# EasyEDA Pro project P3+KG.epro, board PCB5
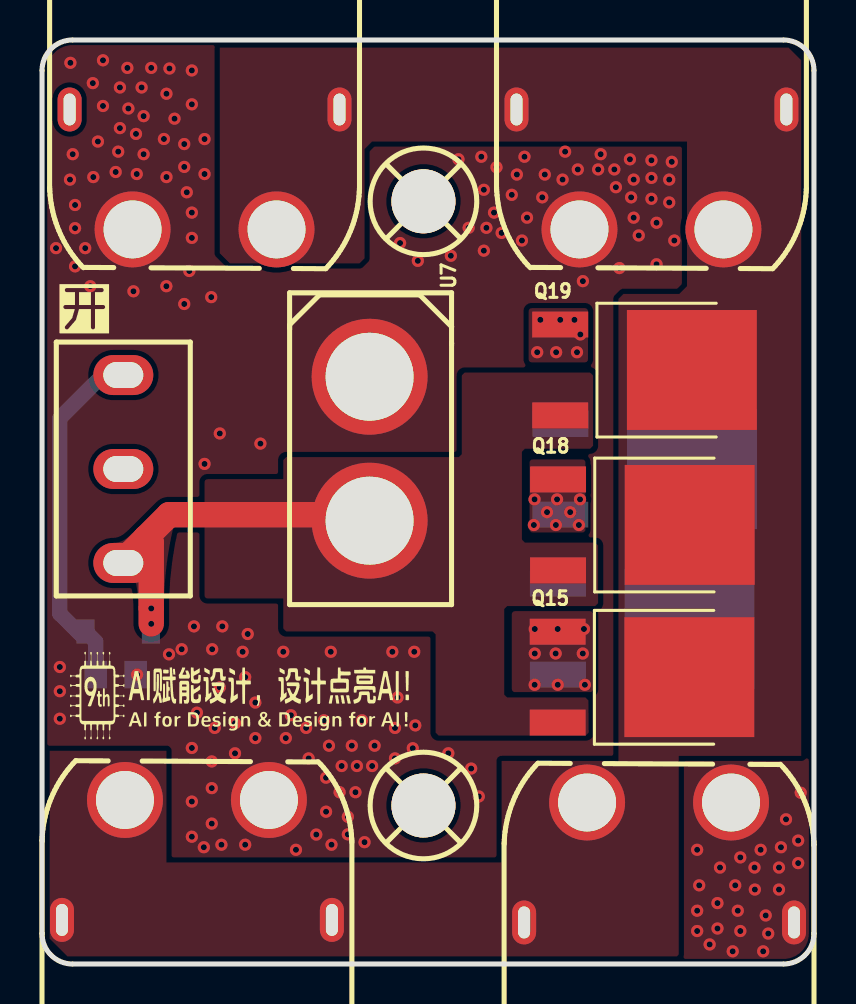
[diagram p7: board, top side]
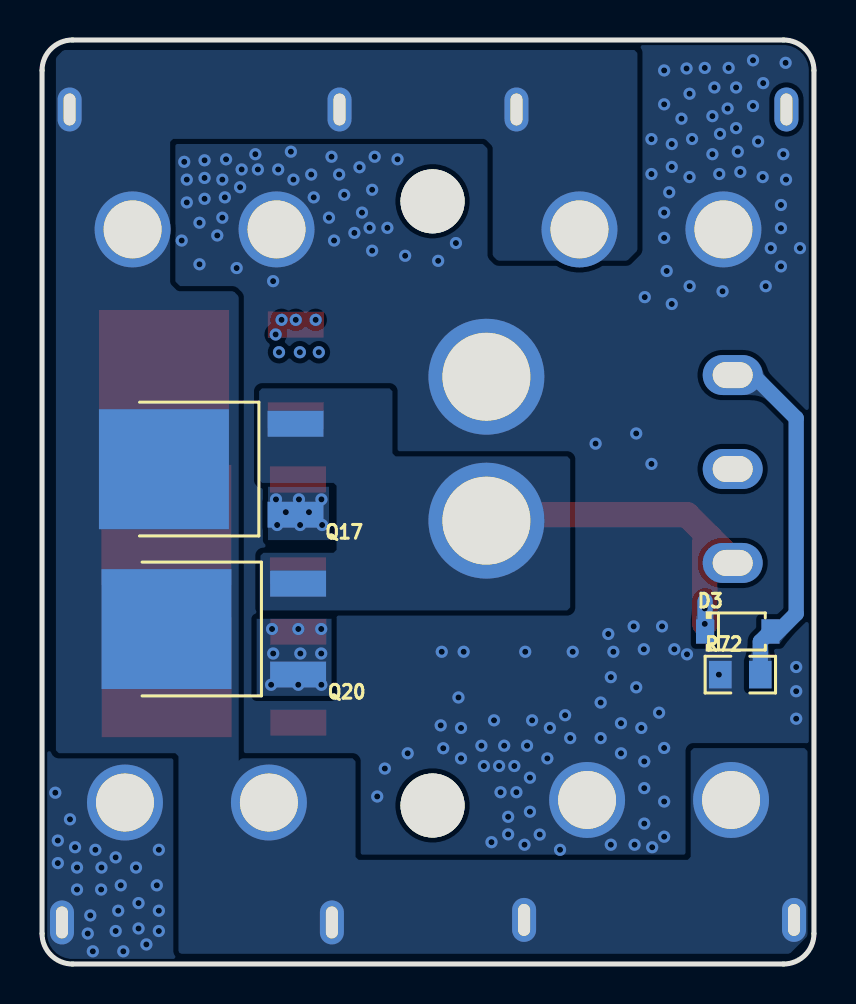
[diagram p8: board, bottom side, seen from below]

Outline 38.61 x 46.23 mm; copper layers: Top Layer, Inner1, Inner2, Bottom Layer. Coordinates in mm from the lower left corner of the outline.
Outline path: 0,44.7 0,1.52 arc(0.45,0.45) 1.52,0 37.08,0 arc(38.16,0.45) 38.61,1.52 38.61,44.7 arc(38.16,45.78) 37.08,46.23 1.52,46.23 arc(0.45,45.78) 0,44.7
Stack: Top Layer 0.035mm 外层铜厚1oz / Dielectric1 0.2104mm 7628 RC49% 8.6mil / Inner1 0.0152mm 内层铜厚 / Dielectric2 1.065mm 1.1mm H/HOZ Copper / Inner2 0.0152mm 内层铜厚 / Dielectric3 0.2104mm 7628 RC49% 8.6mil / Bottom Layer 0.035mm 外层铜厚1oz

## Design rules (mm)
template: 自定义配置
spacing copperThickness1oz (default): track to track 0.102, other pairs 0.152 to 0.3
spacing copperThickness2oz: track to track 0.203, other pairs 0.152 to 0.3
track width copperThickness1oz (default): min 0.127, default 0.254, max 2.54
track width copperThickness2oz: min 0.203, default 0.254, max 2.54
differential pair differentialPair (default): width min 0.127, default 0.254, max 2.54; gap min 0.152, default 0.152
via viaSize (default): diameter min 0.5, default 0.61, max 10; hole min 0.3, default 0.305, max 6.3

## Placement (name value [footprint] x y rotation side)
CN8  XT60PW-M  [CONN-TH_XT60PW-M]  30.48 39.75 270 top
CN9  XT60PW-M  [CONN-TH_XT60PW-M]  8.13 39.75 270 top
CN10  XT60PW-M  [CONN-TH_XT60PW-M]  30.86 5.08 90 top
CN11  XT60PW-M  [CONN-TH_XT60PW-M]  7.75 5.21 90 top
D3  BZT52C16  [SOD-123_L2.7-W1.6-LS3.7-RD]  3.81 16.64 180 bottom
Q15  HY19P03D  [TO-252-2_L6.6-W6.1-P4.57-LS9.9-TL-CW]  29.08 14.35 0 top
Q17  HY19P03D  [TO-252-2_L6.6-W6.1-P4.57-LS9.9-TL-CW]  29.22 24.76 0 bottom
Q18  HY19P03D  [TO-252-2_L6.6-W6.1-P4.57-LS9.9-TL-CW]  29.1 21.97 0 top
Q19  HY19P03D  [TO-252-2_L6.6-W6.1-P4.57-LS9.9-TL-CW]  29.21 29.72 0 top
Q20  HY19P03D  [TO-252-2_L6.6-W6.1-P4.57-LS9.9-TL-CW]  29.09 16.75 0 bottom
R72  10K  [R0805]  3.68 14.48 180 bottom
SCREW1  -  [M3螺丝]  19.08 38.16 0 top
SCREW3  -  [M3螺丝]  19.08 7.93 0 top
SW10  SS-12D10L5  [SW-TH_SS-12D10L5]  4.06 24.77 90 top
U7  XT60-M.  [CONN-TH_XT60]  16.38 25.78 270 top

## Footprints (pads in the part's own frame, mm; a bottom-side part is the same pattern mirrored in y, then rotated)
CONN-TH_XT60
  round 5.8 hole 4.4: 1(-3.6,0) 2(3.6,0)
CONN-TH_XT60PW-M
  round 3.8 hole 2.9: 1(3,-3.6) 2(3,3.6)
  oval 2.2x1.2 hole 1.6x0.6: 3(-3,6.75) 4(-3,-6.75)
M3螺丝
  round 3.2 hole 3.2: 1(0,0)
R0805
  rect 1.133x1.377 smd: 1(-1,0) 2(1,0)
SOD-123_L2.7-W1.6-LS3.7-RD
  rect 0.91x1.22 smd: 1(-1.635,0) 2(1.635,0)
SW-TH_SS-12D10L5
  oval 2x3 hole 1.3x2: 1(-4.7,0) 2(0,0) 3(4.7,0)
TO-252-2_L6.6-W6.1-P4.57-LS9.9-TL-CW
  rect 2.8x1.3 smd: 1(-3.292,2.273) 3(-3.292,-2.273)
  rect 6.5x6 smd: 2(3.292,0)

## Nets
As in the schematic.

Pads without a net: CN9 4; SCREW1 1; SCREW3 1

## Via types
v1: diameter 0.61, hole 0.305, Top Layer to Bottom Layer, 204 vias

## Routing (per net, layer and track width the routed paths; a pad name or vN(x,y) marks a point on that pad's centre or on a via; arc(x,y) is an arc through that point)
GND:
  vias: v1(0.7,35.81) v1(0.89,14.86) v1(0.89,13.65) v1(0.89,12.27) v1(1.42,45.09) v1(1.4,39.24) v1(1.53,40.51) v1(1.65,37.97) v1(1.65,36.81) v1(1.65,34.9) v1(2.16,35.81) v1(2.41,33.91) v1(2.54,44.07) v1(2.56,39.37) v1(2.79,41.15) v1(3.05,45.21) v1(3.05,42.93) v1(3.68,39.62) v1(3.81,40.64) v1(3.9,43.85) v1(3.9,41.82) v1(4.27,44.83) v1(4.32,42.8) v1(4.57,33.66) v1(4.7,41.53) v1(4.74,39.52) v1(4.76,14.48) v1(4.98,43.85) v1(5.08,42.42) v1(5.08,40.51) v1(5.46,44.83) v1(6.1,41.28) v1(6.22,43.54) v1(6.22,39.37) v1(6.22,33.91) v1(6.35,15.49) v1(6.37,44.8) v1(6.63,42.29) v1(6.99,15.75) v1(7.11,41.02) v1(7.11,39.88) v1(7.11,33.02) v1(7.24,38.61) v1(7.37,34.67) v1(7.49,44.7) v1(7.49,43.01) v1(7.49,37.59) v1(7.49,36.33) v1(7.49,10.81) v1(7.49,8.13) v1(7.49,6.37) v1(7.6,16.89) v1(7.75,12.57) v1(8.13,41.27) v1(8.13,39.52) v1(8.13,25.02) v1(8.09,5.84) v1(8.46,33.36) v1(8.51,15.75) v1(8.49,10.14) v1(8.49,8.8) v1(8.49,7.02) v1(8.64,11.81) v1(8.89,26.54) v1(8.89,13.84) v1(9.02,16.89) v1(8.97,5.97) v1(9.65,12.05) v1(9.65,10.54) v1(10.03,15.62) v1(10.16,14.35) v1(10.16,5.97) v1(10.29,16.51) v1(10.67,13.08) v1(10.67,11.3) v1(10.92,26.03) v1(12.06,15.62) v1(12.19,11.3) v1(12.45,12.45) v1(12.7,5.72) v1(13.21,11.81) v1(13.34,10.29) v1(13.72,6.48) v1(14.1,12.19) v1(14.21,9.32) v1(14.21,7.62) v1(14.35,10.92) v1(14.44,15.62) v1(14.48,5.97) v1(14.88,8.59) v1(14.99,9.91) v1(15.3,7.37) v1(15.3,6.49) v1(15.49,10.92) v1(15.75,9.91) v1(15.68,8.59) v1(16,12.19) v1(16.13,6.1) v1(16.51,9.91) v1(16.63,10.92) v1(17.52,15.62) v1(17.65,11.81) v1(17.65,10.29) v1(17.78,13.34) v1(17.91,36.07) v1(18.54,10.8) v1(18.62,15.62) v1(18.67,11.94) v1(18.8,35.18) v1(20.32,10.54) v1(20.45,35.43) v1(20.83,40.26) v1(21.34,36.83) v1(21.46,9.78) v1(21.84,8.38) v1(21.97,40.39) v1(22.1,38.73) v1(22.1,35.69) v1(22.22,36.83) v1(22.61,37.59) v1(22.73,39.86) v1(22.99,36.58) v1(23.5,38.48) v1(23.75,39.5) v1(24,36.2) v1(24.13,40.39) v1(24.26,37.34) v1(25.02,38.35) v1(25.15,39.5) v1(26.03,39.24) v1(26.16,40.64) v1(26.8,39.75) v1(27.05,34.16) v1(27.81,39.75) v1(27.94,40.51) v1(28.62,39.75) v1(28.7,38.86) v1(28.88,34.82) v1(29.4,40.26) v1(29.46,38.35) v1(29.59,39.24) v1(29.59,37.34) v1(29.84,36.45) v1(30.48,40.21) v1(30.48,39.33) v1(30.48,38.28) v1(30.73,37.08) v1(30.73,35.01) v1(31.37,39.24) v1(31.37,38.1) v1(31.5,40.13) v1(31.62,36.2) v1(32.77,5.72) v1(32.77,2.67) v1(32.77,1.65) v1(32.87,3.94) v1(33.39,0.98) v1(33.78,3.05) v1(33.78,1.78) v1(33.91,4.83) v1(34.54,0.64) v1(34.67,3.94) v1(34.8,2.67) v1(34.93,5.33) v1(34.93,1.65) v1(35.64,4.83) v1(35.65,3.73) v1(35.94,5.72) v1(36.07,0.64) v1(36.19,2.43) v1(36.32,1.52) v1(36.86,4.83) v1(36.86,3.73) v1(36.96,5.84) v1(37.21,7.24) v1(37.82,6.18) v1(37.82,5.05) v1(37.95,8.57)
VM: length 19.4
  Top Layer w1.27: 5.21,21.34 4.06,20.19 ; 5.21,21.34 6.35,22.48 16.09,22.48 U7.2 ; 5.21,21.34 5.46,21.08 v1(5.46,17.79) v1(5.46,17.02)
  Bottom Layer w0.762: 5.44,17 5.44,18.16 ; 5.44,17 D3.1 ; 5.44,17 v1(5.46,17.02)
$1N554: length 43.2
  Inner1 w1.27: 4.06,24.89 12.83,33.66 23.5,33.66 v1(24.92,32.23) 25.4,31.75 25.4,14.35
  vias: v1(24.63,23.25) v1(24.6,21.96) v1(24.65,16.76) v1(24.65,15.53) v1(24.64,13.97) v1(24.77,30.61) v1(25.26,22.61) v1(25.71,30.61) v1(25.76,23.25) v1(25.7,21.96) v1(25.69,15.53) v1(25.79,16.76) v1(25.79,13.97) v1(25.92,32.23) v1(26.42,22.61) v1(26.63,32.23) v1(26.76,30.61) v1(26.85,21.96) v1(26.92,31.5) v1(26.91,23.25) v1(27.05,15.53) v1(27.1,16.76) v1(27.15,13.97)
$1N557: length 17.7
  Bottom Layer w0.762: D3.2 2.68,16.13 R72.2 ; 4.06,29.59 3.18,29.59 0.89,27.31 0.89,17.53 1.91,16.51

## Copper pours and planes (outline as drawn; the poured copper is in the pictures)
GND on Top Layer: -19.81,65.91 42.42,65.91 42.42,-18.67 -19.81,-18.67
GND on Top Layer: 8.13,32.22 19.81,32.22 19.81,27.31 8.13,27.31
GND on Bottom Layer: 1.27,39.88 29.97,39.88 29.97,6.22 1.27,6.22
GND on Bottom Layer: -20.83,67.94 116.59,67.94 116.59,-62.48 -20.83,-62.48
GND on Bottom Layer: 33.17,9.12 37.41,9.12 37.41,0.98 33.17,0.98
GND on Inner1: -4.44,48.51 42.04,48.51 42.04,-7.75 -4.44,-7.75
GND on Inner2: 0.26,45.97 38.35,45.97 38.35,0.26 0.26,0.26
VCCB on Top Layer: 0.38,45.85 37.97,45.85 37.97,0.38 0.38,0.38
VCCB on Bottom Layer: 0.32,45.73 37.91,45.73 37.91,0.51 0.32,0.51
VM on Top Layer: 8.13,24.26 19.43,24.26 19.43,18.29 8.13,18.29
VM on Top Layer: 12.06,29.59 27.81,29.59 27.81,11.43 12.06,11.43
VM on Bottom Layer: 12.19,28.8 27.75,28.8 27.75,17.69 12.19,17.69
$1N554 on Top Layer: 24.38,25.24 27.18,25.24 27.18,21.59 24.38,21.59
$1N554 on Top Layer: 24.34,32.81 27.31,32.81 27.31,30.1 24.34,30.1
$1N554 on Top Layer: 23.5,17.65 27.56,17.65 27.56,13.6 23.5,13.6
$1N554 on Bottom Layer: 24.13,17.27 27.87,17.27 27.87,13.41 24.13,13.41
$1N554 on Bottom Layer: 24.26,23.88 27.31,23.88 27.31,21.21 24.26,21.21
$1N554 on Inner1: 24.38,32.64 27.56,32.64 27.56,13.34 24.38,13.34

Small or netless copper shapes (teardrops, artwork), in the pictures only: 5 on Top Layer, 4 on Bottom Layer, 1 on Inner1

## Text on the board
Top Silkscreen Layer: 开
